# Altium schematic sheet 8.HDMI2.SchDoc
size 297 x 209 mm; SheetNumber: 8; SheetTotal: 14
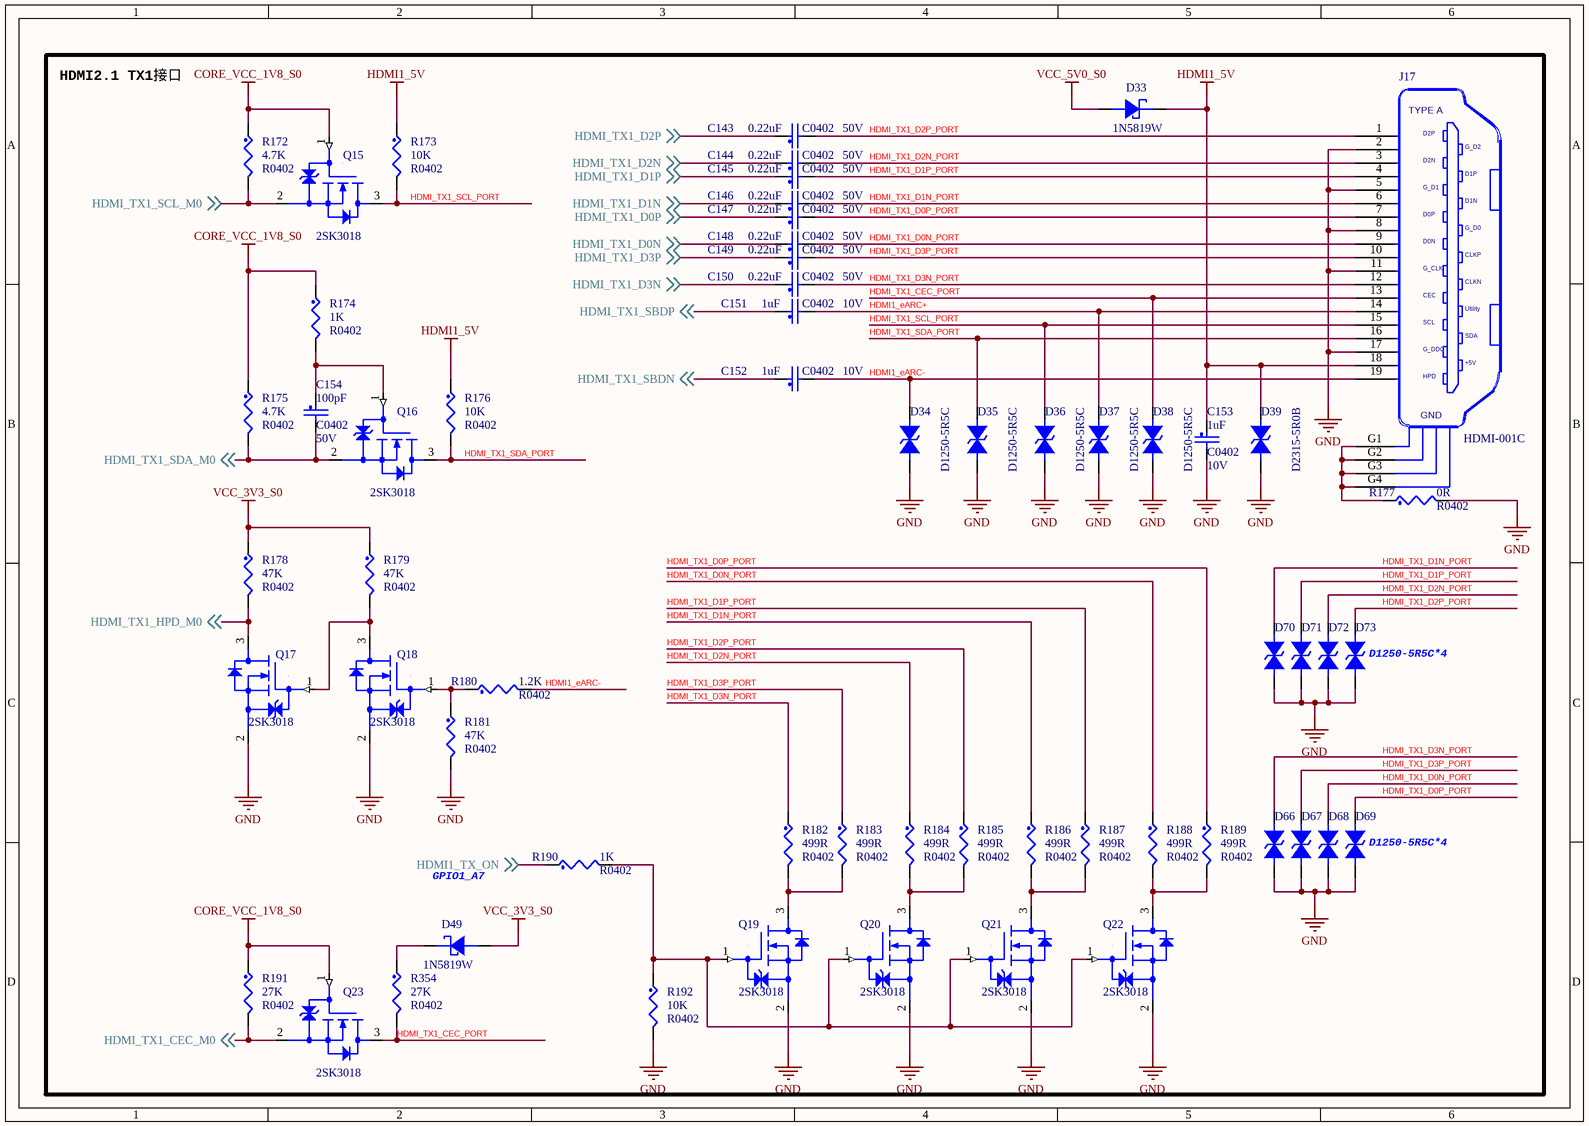
[diagram p0: 8.HDMI2.SchDoc]

## Parts
C143  0.22uF  Voltage: 50V  [C0402]
C144  0.22uF  Voltage: 50V  [C0402]
C145  0.22uF  Voltage: 50V  [C0402]
C146  0.22uF  Voltage: 50V  [C0402]
C147  0.22uF  Voltage: 50V  [C0402]
C148  0.22uF  Voltage: 50V  [C0402]
C149  0.22uF  Voltage: 50V  [C0402]
C150  0.22uF  Voltage: 50V  [C0402]
C151  1uF  Voltage: 10V  [C0402]
C152  1uF  Voltage: 10V  [C0402]
C153  1uF  Voltage: 10V  [C0402]
C154  100pF  Voltage: 50V  [C0402]
D33  1N5819W  [SOD-123]
D34  D1250-5R5C  [esd0402]
D35  D1250-5R5C  [esd0402]
D36  D1250-5R5C  [esd0402]
D37  D1250-5R5C  [esd0402]
D38  D1250-5R5C  [esd0402]
D39  D2315-5R0B  [esd0402]
D49  1N5819W  [SOD-123]
D66  D1250-5R5C  [esd0402]  (value not drawn)
D67  D1250-5R5C  [esd0402]  (value not drawn)
D68  D1250-5R5C  [esd0402]  (value not drawn)
D69  D1250-5R5C  [esd0402]  (value not drawn)
D70  D1250-5R5C  [esd0402]  (value not drawn)
D71  D1250-5R5C  [esd0402]  (value not drawn)
D72  D1250-5R5C  [esd0402]  (value not drawn)
D73  D1250-5R5C  [esd0402]  (value not drawn)
J17  HDMI-001C  [HDMI-SMD]
Q15  2SK3018  [SOT23]
Q16  2SK3018  [SOT23]
Q17  2SK3018  [SOT23]
Q18  2SK3018  [SOT23]
Q19  2SK3018  [SOT23]
Q20  2SK3018  [SOT23]
Q21  2SK3018  [SOT23]
Q22  2SK3018  [SOT23]
Q23  2SK3018  [SOT23]
R172  4.7K  [R0402]
R173  10K  [R0402]
R174  1K  [R0402]
R175  4.7K  [R0402]
R176  10K  [R0402]
R177  0R  [R0402]
R178  47K  [R0402]
R179  47K  [R0402]
R180  1.2K  [R0402]
R181  47K  [R0402]
R182  499R  [R0402]
R183  499R  [R0402]
R184  499R  [R0402]
R185  499R  [R0402]
R186  499R  [R0402]
R187  499R  [R0402]
R188  499R  [R0402]
R189  499R  [R0402]
R190  1K  [R0402]
R191  27K  [R0402]
R192  10K  [R0402]
R354  27K  [R0402]

## Nets
CORE_VCC_1V8_S0: Q15.1(GATE) Q23.1(GATE) R172.1 R174.1 R175.1 R191.1
GND: C153.2 D34.1 D35.1 D36.1 D37.1 D38.1 D39.1 D66.1 D67.1 D68.1 D69.1 D70.1 D71.1 D72.1 D73.1 J17.2 J17.5 J17.8 J17.11 J17.17 Q17.2(SOURCE) Q18.2(SOURCE) Q19.2(SOURCE) Q20.2(SOURCE) Q21.2(SOURCE) Q22.2(SOURCE) R177.2 R181.2 R192.2
HDMI1_5V: C153.1 D33.1 D39.2 J17.18 R173.1 R176.1
VCC_3V3_S0: D49.2 R178.1 R179.1
VCC_5V0_S0: D33.2
HDMI1_eARC+: C151.2 D37.2 J17.14
HDMI1_eARC-: C152.2 D34.2 J17.19 R180.2
HDMI1_TX_ON: R190.1 ; off-sheet HDMI1_TX_ON
HDMI_TX1_CEC_M0: Q23.2(SOURCE) R191.2 ; off-sheet HDMI_TX1_CEC_M0
HDMI_TX1_CEC_PORT: D38.2 J17.13 Q23.3(DRAIN) R354.2
HDMI_TX1_D0N: C148.1 ; off-sheet HDMI_TX1_D0N
HDMI_TX1_D0N_PORT: C148.2 D68.2 J17.9 R188.1
HDMI_TX1_D0P: C147.1 ; off-sheet HDMI_TX1_D0P
HDMI_TX1_D0P_PORT: C147.2 D69.2 J17.7 R189.1
HDMI_TX1_D1N: C146.1 ; off-sheet HDMI_TX1_D1N
HDMI_TX1_D1N_PORT: C146.2 D70.2 J17.6 R186.1
HDMI_TX1_D1P: C145.1 ; off-sheet HDMI_TX1_D1P
HDMI_TX1_D1P_PORT: C145.2 D71.2 J17.4 R187.1
HDMI_TX1_D2N: C144.1 ; off-sheet HDMI_TX1_D2N
HDMI_TX1_D2N_PORT: C144.2 D72.2 J17.3 R184.1
HDMI_TX1_D2P: C143.1 ; off-sheet HDMI_TX1_D2P
HDMI_TX1_D2P_PORT: C143.2 D73.2 J17.1 R185.1
HDMI_TX1_D3N: C150.1 ; off-sheet HDMI_TX1_D3N
HDMI_TX1_D3N_PORT: C150.2 D66.2 J17.12 R182.1
HDMI_TX1_D3P: C149.1 ; off-sheet HDMI_TX1_D3P
HDMI_TX1_D3P_PORT: C149.2 D67.2 J17.10 R183.1
HDMI_TX1_HPD_M0: Q17.3(DRAIN) R178.2 ; off-sheet HDMI_TX1_HPD_M0
HDMI_TX1_SBDN: C152.1 ; off-sheet HDMI_TX1_SBDN
HDMI_TX1_SBDP: C151.1 ; off-sheet HDMI_TX1_SBDP
HDMI_TX1_SCL_M0: Q15.2(SOURCE) R172.2 ; off-sheet HDMI_TX1_SCL_M0
HDMI_TX1_SCL_PORT: D36.2 J17.15 Q15.3(DRAIN) R173.2
HDMI_TX1_SDA_M0: C154.2 Q16.2(SOURCE) R175.2 ; off-sheet HDMI_TX1_SDA_M0
HDMI_TX1_SDA_PORT: D35.2 J17.16 Q16.3(DRAIN) R176.2
NetC154_1: C154.1 Q16.1(GATE) R174.2
NetD49_1: D49.1 R354.1
NetJ17_G1: J17.G1 J17.G2 J17.G3 J17.G4 R177.1
NetQ17_1: Q17.1(GATE) Q18.3(DRAIN) R179.2
NetQ18_1: Q18.1(GATE) R180.1 R181.1
NetQ19_1: Q19.1(GATE) Q20.1(GATE) Q21.1(GATE) Q22.1(GATE) R190.2 R192.1
NetQ19_3: Q19.3(DRAIN) R182.2 R183.2
NetQ20_3: Q20.3(DRAIN) R184.2 R185.2
NetQ21_3: Q21.3(DRAIN) R186.2 R187.2
NetQ22_3: Q22.3(DRAIN) R188.2 R189.2

## Notes on the sheet
- HDMI2.1 TX1接口
- (near D73) D1250-5R5C*4
- GPIO1_A7
- (near D69) D1250-5R5C*4
- (in symbol HDMI-001C) TYPE A; D2P; G_D2; D2N; D1P; G_D1; D1N; D0P; G_D0; D0N; CLKP; G_CLK; CLKN; CEC; Utility; SCL; SDA; G_DDC; +5V; HPD; GND

## Library data of the parts
C143-C150 = CAP_NP: CLASS: DISCRETE; 生命周期: 量产; 价格: 0.074942; 规格书: 太诱-贴片电容.pdf; 类别: 贴片电容0402; 品牌: 太诱; 条码: EBF29060266; 规格编号: UMK105BJ224MV-F; 规格: 贴片电容0.22uF 20% 50V X5R 0402; PCB Footprint: C0402
C151-C153 = CAP_NP: CLASS: DISCRETE; 生命周期: 量产; 价格: 0.01191; 规格书: 风华电容.pdf; 类别: 贴片电容0402; 品牌: 风华; 条码: EBF29060121; 规格编号: 0402X105K100NT; 规格: 贴片电容1uF 10% 10V X5R 0402; PCB Footprint: C0402
C154 = CAP_NP: CLASS: DISCRETE; 生命周期: 量产; 价格: 0.034837; 规格书: 村田040系列贴片电容.pdf; 类别: 贴片电容0402; 品牌: 村田; 条码: EBF29060302; 规格编号: GRT1555C1H101JA; 规格: 贴片电容100pF 5% 50V C0G 0402; PCB Footprint: C0402
D33 = DIODE_SCHTKY: CLASS: IC; 丝印: SL; 生命周期: 量产; 价格: 0.175675; 规格书: 1N5819W.pdf; 类别: 贴片肖特基二极管; 品牌: 台湾迪嘉; 条码: EBF29140016; 规格: 肖特基二极管 直流反向耐压40V 平均整流电流1A 正向压降0.6V@1A SOD-123; 规格编号: 1N5819W; PCB Footprint: SOD-123
D34-D38 = DIODE BI-DIR TRIG: PCB Footprint: R0201; 备注: 应用于HDMI2.1; 生命周期: 量产; 规格书: 千虹_D1250-5R5C.pdf; 类别: 贴片ESD; 品牌: 千虹; 条码: EBFCIS240604160037; 规格: 防静电保护ESD二极管 反向工作电压5.5V 击穿电压6V 钳位电压10.5V 结电容Cj 0.17pF; 规格编号: D1250-5R5C
D39 = DIODE BI-DIR TRIG: 备注: 通用; 生命周期: 量产; 规格书: 千虹_D2315-5R0B.pdf; 类别: 贴片ESD; 品牌: 千虹; 条码: EBFCIS240517170922; 规格: 防静电保护ESD二极管 反向工作电压5V 击穿电压7V 钳位电压10.5V 结电容Cj 0.3pF; PCB Footprint: esd0402; 规格编号: D2315-5R0B
D49 = DIODE_SCHTKY: CLASS: IC; 规格: 肖特基二极管 直流反向耐压40V 平均整流电流1A 正向压降0.6V@1A SOD-123; 条码: EBF29140016; 品牌: 台湾迪嘉; 类别: 贴片肖特基二极管; 规格书: 1N5819W.pdf; 价格: 0.175675; 生命周期: 量产; 丝印: SL; 规格编号: 1N5819W; PCB Footprint: SOD-123
D66-D73 = DIODE BI-DIR TRIG: PCB Footprint: R0201; 规格: 防静电保护ESD二极管 反向工作电压5.5V 击穿电压6V 钳位电压10.5V 结电容Cj 0.17pF; 条码: EBFCIS240604160037; 品牌: 千虹; 类别: 贴片ESD; 规格书: 千虹_D1250-5R5C.pdf; 生命周期: 量产; 备注: 应用于HDMI2.1; 规格编号: D1250-5R5C
J17 = HDMI-001C: VPN: 1166-2C105-211; Vendor: Comtek; OriginalSymbolOrigin: (-200,650); CLASS: IO; 规格: HDMI立式; 条码: EBF29040081; 品牌: 讯普; 类别: HDMI连接器; 规格书: HDMI-001C.pdf; 生命周期: 量产; PCB Footprint: HDMI-SMD; 规格编号: HDMI-001C
Q15 Q16 Q18 = 2SK3018: CLASS: IC; 规格: N沟道MOS 导通电阻8Ω 电流10mA 0.8V可驱动; 条码: EBF29280009; 品牌: 江苏长电; 类别: N-MOS; 规格书: 长电科技-2SK3018.pdf; 价格: 0.120725; 生命周期: 量产; 丝印: KN; PCB Footprint: SOT23; 规格编号: 2SK3018
Q17 Q19-Q23 = 2SK3018: CLASS: IC; 丝印: KN; 生命周期: 量产; 价格: 0.120725; 规格书: 长电科技-2SK3018.pdf; 类别: N-MOS; 品牌: 江苏长电; 条码: EBF29280009; 规格: N沟道MOS 导通电阻8Ω 电流10mA 0.8V可驱动; 规格编号: 2SK3018; PCB Footprint: SOT23
R172 R175 = RES: CLASS: DISCRETE; 生命周期: 量产; 规格书: 合科泰-RI系列电阻.pdf; 类别: 贴片电阻0402; 品牌: 合科泰; 条码: EBF29070047; 规格编号: RI0402L4701FT; 规格: 贴片电阻4.7K 1% 1/16W 0402; PCB Footprint: R0402
R173 R176 R192 = RES: CLASS: DISCRETE; 生命周期: 量产; 价格: 0.002773; 规格书: 厚声-无铅厚膜电阻.pdf; 类别: 贴片电阻0402; 品牌: 厚声; 条码: EBF29070046; 规格编号: 0402WGF1002TCE; 规格: 贴片电阻10K 1% 1/16W 0402; PCB Footprint: R0402
R174 = RES: CLASS: DISCRETE; 生命周期: 量产; 规格书: 合科泰-RI系列电阻.pdf; 类别: 贴片电阻0402; 品牌: 合科泰; 条码: EBF29070050; 规格编号: RI0402L1001FT; 规格: 贴片电阻1K 1% 1/16W 0402; PCB Footprint: R0402
R177 = RES: CLASS: DISCRETE; 规格: 贴片电阻0R 1% 1/16W 0402; 规格编号: RI0402L000FT; 条码: EBF29070049; 品牌: 合科泰; 类别: 贴片电阻0402; 规格书: 合科泰-RI系列电阻.pdf; 生命周期: 量产; PCB Footprint: R0402
R178 R179 = RES: CLASS: DISCRETE; 生命周期: 量产; 规格书: 厚声-无铅厚膜电阻.pdf; 类别: 贴片电阻0402; 品牌: 厚声; 条码: EBF29070247; 规格编号: 0402WGF4702TCE; 规格: 贴片电阻47K 1% 1/16W 0402; PCB Footprint: R0402
R180 = RES: CLASS: DISCRETE; 价格: 0.001447; 规格书: 厚声-无铅厚膜电阻.pdf; 类别: 贴片电阻0402; 品牌: 厚声; 条码: EBFCIS221112112140; 规格编号: 0402WGF1201TCE; 规格: 贴片电阻1.2K 1% 1/16W 0402; 生命周期: 量产; PCB Footprint: R0402
R181 = RES: CLASS: DISCRETE; 规格: 贴片电阻47K 1% 1/16W 0402; 规格编号: 0402WGF4702TCE; 条码: EBF29070247; 品牌: 厚声; 类别: 贴片电阻0402; 规格书: 厚声-无铅厚膜电阻.pdf; 生命周期: 量产; PCB Footprint: R0402
R182 R184 R187 R189 = RES: CLASS: DISCRETE; 生命周期: 量产; 价格: 0.003791; 规格书: 厚声-无铅厚膜电阻.pdf; 类别: 贴片电阻0402; 品牌: 厚声; 条码: EBF29070287; 规格编号: 0402WGF4990TCE; 规格: 贴片电阻499R 1% 1/16W 0402; PCB Footprint: R0402
R183 R185 R186 R188 = RES: CLASS: DISCRETE; 规格: 贴片电阻499R 1% 1/16W 0402; 规格编号: 0402WGF4990TCE; 条码: EBF29070287; 品牌: 厚声; 类别: 贴片电阻0402; 规格书: 厚声-无铅厚膜电阻.pdf; 价格: 0.003791; 生命周期: 量产; PCB Footprint: R0402
R190 = RES: CLASS: DISCRETE; 规格: 贴片电阻1K 1% 1/16W 0402; 规格编号: RI0402L1001FT; 条码: EBF29070050; 品牌: 合科泰; 类别: 贴片电阻0402; 规格书: 合科泰-RI系列电阻.pdf; 生命周期: 量产; PCB Footprint: R0402
R191 = RES: CLASS: DISCRETE; 生命周期: 量产; 价格: 0.007054; 规格书: YAGEO国巨厚膜无铅电阻.pdf; 类别: 贴片电阻0402; 品牌: 国巨; 条码: EBF29070003; 规格编号: AC0402FR-0727KL; 规格: 贴片电阻27K 1% 1/16W 0402; PCB Footprint: R0402
R354 = RES: CLASS: DISCRETE; 规格: 贴片电阻27K 1% 1/16W 0402; 规格编号: AC0402FR-0727KL; 条码: EBF29070003; 品牌: 国巨; 类别: 贴片电阻0402; 规格书: YAGEO国巨厚膜无铅电阻.pdf; 价格: 0.007054; 生命周期: 量产; PCB Footprint: R0402